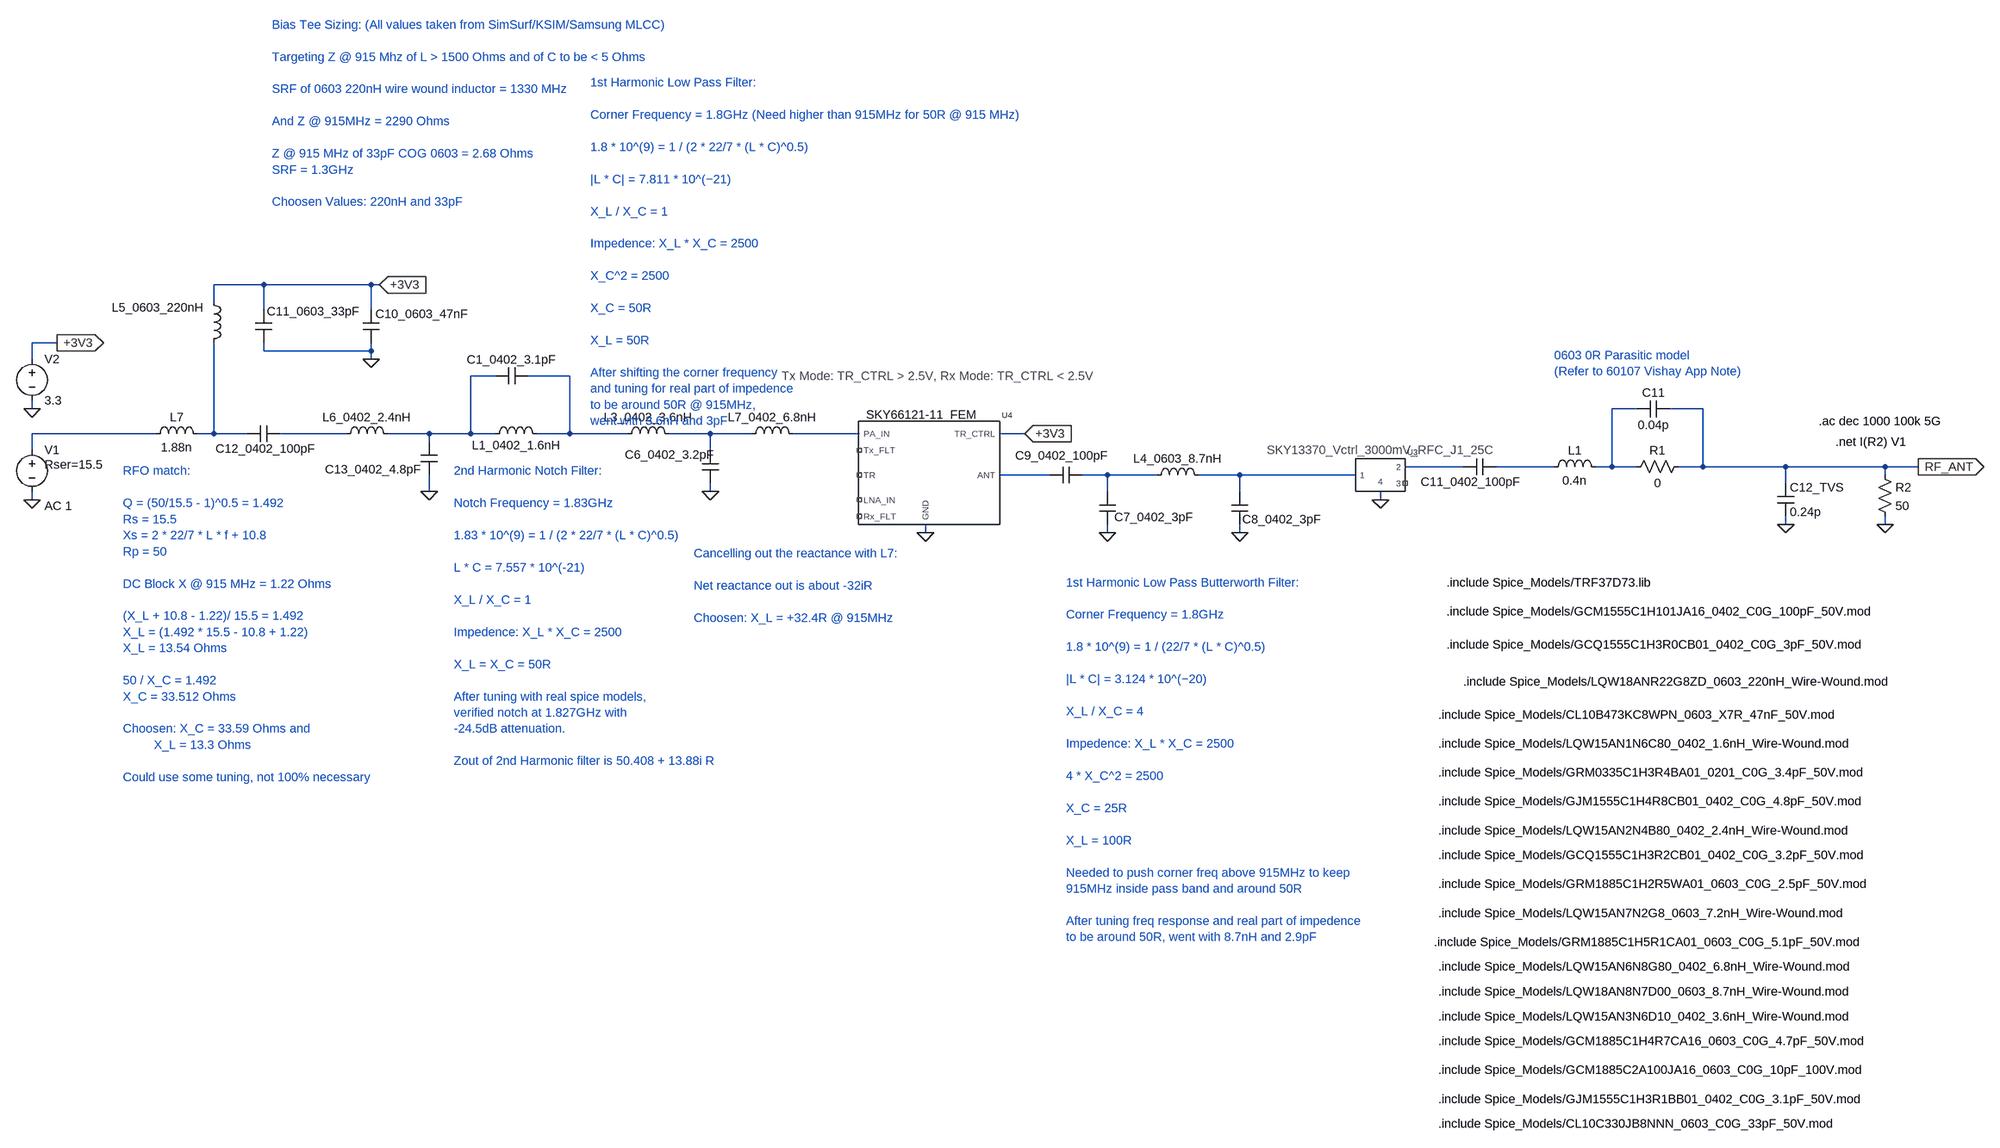
[diagram p0: schematic RF_Front_End_Real.asc]
RF_Front_End_Real.asc, the LTspice schematic file:
Version 4.1
SHEET 1 4856 1496
WIRE -1264 -240 -1360 -240
WIRE -1056 -240 -1264 -240
WIRE -1040 -240 -1056 -240
WIRE -1360 -208 -1360 -240
WIRE -1264 -192 -1264 -240
WIRE -1056 -192 -1056 -240
WIRE -1664 -128 -1712 -128
WIRE -1264 -112 -1264 -128
WIRE -1056 -112 -1056 -128
WIRE -1056 -112 -1264 -112
WIRE -1712 -96 -1712 -128
WIRE -1056 -96 -1056 -112
WIRE -816 -64 -864 -64
WIRE -672 -64 -752 -64
WIRE -1712 0 -1712 -16
WIRE 1392 0 1344 0
WIRE 1520 0 1456 0
WIRE -1472 48 -1712 48
WIRE -1360 48 -1360 -128
WIRE -1360 48 -1392 48
WIRE -1296 48 -1360 48
WIRE -1104 48 -1232 48
WIRE -944 48 -1024 48
WIRE -864 48 -864 -64
WIRE -864 48 -944 48
WIRE -816 48 -864 48
WIRE -672 48 -672 -64
WIRE -672 48 -736 48
WIRE -560 48 -672 48
WIRE -400 48 -480 48
WIRE -320 48 -400 48
WIRE -112 48 -240 48
WIRE 208 48 160 48
WIRE -944 64 -944 48
WIRE -1712 80 -1712 48
WIRE -400 80 -400 48
WIRE 1056 112 944 112
WIRE 1232 112 1120 112
WIRE 1344 112 1344 0
WIRE 1344 112 1312 112
WIRE 1392 112 1344 112
WIRE 1520 112 1520 0
WIRE 1520 112 1472 112
WIRE 1680 112 1520 112
WIRE 1872 112 1680 112
WIRE 1936 112 1872 112
WIRE 256 128 160 128
WIRE 368 128 320 128
WIRE 464 128 368 128
WIRE 624 128 544 128
WIRE 848 128 624 128
WIRE 1872 128 1872 112
WIRE 1680 144 1680 112
WIRE -944 160 -944 128
WIRE -400 160 -400 144
WIRE 368 160 368 128
WIRE 624 160 624 128
WIRE -1712 176 -1712 160
WIRE 896 176 896 160
WIRE 1680 224 1680 208
WIRE 1872 224 1872 208
WIRE 16 240 16 224
WIRE 368 240 368 224
WIRE 624 240 624 224
FLAG -400 160 0
FLAG 368 240 0
FLAG 624 240 0
FLAG 1936 112 RF_ANT
IOPIN 1936 112 Out
FLAG -1712 176 0
FLAG 1872 224 0
FLAG -1056 -96 0
FLAG -944 160 0
FLAG -1712 0 0
FLAG -1664 -128 +3V3
IOPIN -1664 -128 Out
FLAG -1040 -240 +3V3
IOPIN -1040 -240 In
FLAG 1680 224 0
FLAG 896 176 0
FLAG 208 48 +3V3
IOPIN 208 48 In
FLAG 16 240 0
SYMBOL ind -832 64 R270
WINDOW 0 -22 57 VTop 2
WINDOW 3 5 56 Invisible 2
SYMATTR InstName L1_0402_1.6nH
SYMATTR Value LQW15AN2N4B80
SYMATTR Prefix X
SYMBOL cap -752 -80 R90
WINDOW 0 0 32 VBottom 2
WINDOW 3 32 32 Invisible 2
SYMATTR InstName C1_0402_3.1pF
SYMATTR Value GJM1555C1H3R1BB01_DC0V_25degC
SYMATTR Prefix X
SYMBOL ind -576 64 R270
WINDOW 0 32 56 VTop 2
WINDOW 3 5 56 Invisible 2
SYMATTR InstName L3_0402_3.6nH
SYMATTR Value LQW15AN3N6D10
SYMATTR Prefix X
SYMBOL cap -416 80 R0
WINDOW 0 -149 9 Left 2
WINDOW 3 -149 37 Invisible 2
SYMATTR InstName C6_0402_3.2pF
SYMATTR Value GCQ1555C1H3R2CB01_DC0V_25degC
SYMATTR Prefix X
SYMBOL ind 448 144 R270
WINDOW 0 32 56 VTop 2
WINDOW 3 5 56 Invisible 2
SYMATTR InstName L4_0603_8.7nH
SYMATTR Value LQW18AN8N7D00
SYMATTR Prefix X
SYMBOL voltage -1712 64 R0
WINDOW 123 24 124 Left 2
WINDOW 39 24 44 Left 2
SYMATTR Value2 AC 1
SYMATTR SpiceLine Rser=15.5
SYMATTR InstName V1
SYMATTR Value ""
SYMBOL cap 352 160 R0
WINDOW 0 29 50 Left 2
WINDOW 3 24 56 Invisible 2
SYMATTR InstName C7_0402_3pF
SYMATTR Value GCQ1555C1H3R0CB01_DC0V_25degC
SYMATTR Prefix X
SYMBOL res 1856 112 R0
SYMATTR InstName R2
SYMATTR Value 50
SYMBOL ind -1376 -224 R0
WINDOW 0 -182 28 Left 2
WINDOW 3 36 80 Invisible 2
SYMATTR InstName L5_0603_220nH
SYMATTR Value LQW18ANR22G8Z
SYMATTR Prefix X
SYMBOL cap -1072 -192 R0
WINDOW 3 24 56 Invisible 2
SYMATTR Value CL10B473KC8WPN_Precise_DC3.3V_25degC
SYMATTR InstName C10_0603_47nF
SYMATTR Prefix X
SYMBOL cap -1248 -128 R180
WINDOW 0 -171 61 Left 2
WINDOW 3 24 8 Invisible 2
SYMATTR InstName C11_0603_33pF
SYMATTR Value CL10C330JB8NNN_Precise_DC0V_25degC
SYMATTR Prefix X
SYMBOL cap -1232 32 R90
WINDOW 0 61 28 VBottom 2
WINDOW 3 32 32 Invisible 2
SYMATTR InstName C12_0402_100pF
SYMATTR Value GCM1555C1H101JA16_DC0V_25degC
SYMATTR Prefix X
SYMBOL cap -960 64 R0
WINDOW 0 -185 53 Left 2
WINDOW 3 24 56 Invisible 2
SYMATTR InstName C13_0402_4.8pF
SYMATTR Value GJM1555C1H4R8CB01_DC0V_25degC
SYMATTR Prefix X
SYMBOL ind -1120 64 R270
WINDOW 0 32 56 VTop 2
WINDOW 3 5 56 Invisible 2
SYMATTR InstName L6_0402_2.4nH
SYMATTR Value LQW15AN2N4B80
SYMATTR Prefix X
SYMBOL ind -1488 64 R270
WINDOW 0 32 56 VTop 2
WINDOW 3 5 56 VBottom 2
SYMATTR InstName L7
SYMATTR Value 1.88n
SYMATTR SpiceLine Rser=1m
SYMBOL voltage -1712 -112 R0
WINDOW 123 0 0 Left 0
WINDOW 39 0 0 Left 0
SYMATTR InstName V2
SYMATTR Value 3.3
SYMBOL cap 608 160 R0
WINDOW 0 21 54 Left 2
WINDOW 3 24 56 Invisible 2
SYMATTR InstName C8_0402_3pF
SYMATTR Value GCQ1555C1H3R0CB01_DC0V_25degC
SYMATTR Prefix X
SYMBOL cap 1664 144 R0
SYMATTR InstName C12_TVS
SYMATTR Value 0.24p
SYMBOL SKY13370_Vctrl_3000mV_RFC_J1_25C 896 128 R0
SYMATTR InstName U3
SYMBOL cap 1392 16 R270
WINDOW 0 32 32 VTop 2
WINDOW 3 0 32 VBottom 2
SYMATTR InstName C11
SYMATTR Value 0.04p
SYMBOL ind 1216 128 R270
WINDOW 0 32 56 VTop 2
WINDOW 3 5 56 VBottom 2
SYMATTR InstName L1
SYMATTR Value 0.4n
SYMATTR SpiceLine Rser=0
SYMBOL res 1488 96 R90
WINDOW 0 0 56 VBottom 2
WINDOW 3 32 56 VTop 2
SYMATTR InstName R1
SYMATTR Value 0
SYMBOL cap 320 112 R90
WINDOW 0 -6 40 VBottom 2
WINDOW 3 32 32 Invisible 2
SYMATTR InstName C9_0402_100pF
SYMATTR Value GCM1555C1H101JA16_DC0V_25degC
SYMATTR Prefix X
SYMBOL cap 1120 96 R90
WINDOW 0 61 49 VBottom 2
WINDOW 3 32 32 Invisible 2
SYMATTR InstName C11_0402_100pF
SYMATTR Value GCM1555C1H101JA16_DC0V_25degC
SYMATTR Prefix X
SYMBOL Spice_Models\\SKY66121-11_FEM 16 96 R0
SYMATTR InstName U4
SYMBOL ind -336 64 R270
WINDOW 0 32 56 VTop 2
WINDOW 3 5 56 Invisible 2
SYMATTR InstName L7_0402_6.8nH
SYMATTR Value LQW15AN6N8G80
SYMATTR Prefix X
TEXT 1744 24 Left 2 !.ac dec 1000 100k 5G
TEXT 1776 64 Left 2 !.net I(R2) V1
TEXT 1024 456 Left 2 !.include Spice_Models/GCQ1555C1H3R0CB01_0402_C0G_3pF_50V.mod
TEXT 1056 528 Left 2 !.include Spice_Models/LQW18ANR22G8ZD_0603_220nH_Wire-Wound.mod
TEXT 1008 592 Left 2 !.include Spice_Models/CL10B473KC8WPN_0603_X7R_47nF_50V.mod
TEXT 1024 392 Left 2 !.include Spice_Models/GCM1555C1H101JA16_0402_C0G_100pF_50V.mod
TEXT 1008 648 Left 2 !.include Spice_Models/LQW15AN1N6C80_0402_1.6nH_Wire-Wound.mod
TEXT 1008 704 Left 2 !.include Spice_Models/GRM0335C1H3R4BA01_0201_C0G_3.4pF_50V.mod
TEXT 1008 760 Left 2 !.include Spice_Models/GJM1555C1H4R8CB01_0402_C0G_4.8pF_50V.mod
TEXT 1008 816 Left 2 !.include Spice_Models/LQW15AN2N4B80_0402_2.4nH_Wire-Wound.mod
TEXT 1008 864 Left 2 !.include Spice_Models/GCQ1555C1H3R2CB01_0402_C0G_3.2pF_50V.mod
TEXT 1008 920 Left 2 !.include Spice_Models/GRM1885C1H2R5WA01_0603_C0G_2.5pF_50V.mod
TEXT 1008 976 Left 2 !.include Spice_Models/LQW15AN7N2G8_0603_7.2nH_Wire-Wound.mod
TEXT 1000 1032 Left 2 !.include Spice_Models/GRM1885C1H5R1CA01_0603_C0G_5.1pF_50V.mod
TEXT 1008 1080 Left 2 !.include Spice_Models/LQW15AN6N8G80_0402_6.8nH_Wire-Wound.mod
TEXT 1008 1128 Left 2 !.include Spice_Models/LQW18AN8N7D00_0603_8.7nH_Wire-Wound.mod
TEXT 1008 1176 Left 2 !.include Spice_Models/LQW15AN3N6D10_0402_3.6nH_Wire-Wound.mod
TEXT 1024 336 Left 2 !.include Spice_Models/TRF37D73.lib
TEXT -1536 120 Left 2 ;RFO match:\n \nQ = (50/15.5 - 1)^0.5 = 1.492\nRs = 15.5\nXs = 2 * 22/7 * L * f + 10.8\nRp = 50\n \nDC Block X @ 915 MHz = 1.22 Ohms\n \n(X_L + 10.8 - 1.22)/ 15.5 = 1.492\nX_L = (1.492 * 15.5 - 10.8 + 1.22)\nX_L = 13.54 Ohms\n \n50 / X_C = 1.492\nX_C = 33.512 Ohms\n \nChoosen: X_C = 33.59 Ohms and \n         X_L = 13.3 Ohms\n \nCould use some tuning, not 100% necessary
TEXT -1248 -744 Left 2 ;Bias Tee Sizing: (All values taken from SimSurf/KSIM/Samsung MLCC)\n \nTargeting Z @ 915 Mhz of L > 1500 Ohms and of C to be < 5 Ohms\n \nSRF of 0603 220nH wire wound inductor = 1330 MHz\n \nAnd Z @ 915MHz = 2290 Ohms\n \nZ @ 915 MHz of 33pF COG 0603 = 2.68 Ohms\nSRF = 1.3GHz\n \nChoosen Values: 220nH and 33pF
TEXT 1008 1224 Left 2 !.include Spice_Models/GCM1885C1H4R7CA16_0603_C0G_4.7pF_50V.mod
TEXT -896 120 Left 2 ;2nd Harmonic Notch Filter:\n \nNotch Frequency = 1.83GHz\n \n1.83 * 10^(9) = 1 / (2 * 22/7 * (L * C)^0.5)\n \nL * C = 7.557 * 10^(-21)\n \nX_L / X_C = 1\n \nImpedence: X_L * X_C = 2500\n \nX_L = X_C = 50R\n \nAfter tuning with real spice models, \nverified notch at 1.827GHz with \n-24.5dB attenuation.\n \nZout of 2nd Harmonic filter is 50.408 + 13.88i R
TEXT 1008 1280 Left 2 !.include Spice_Models/GCM1885C2A100JA16_0603_C0G_10pF_100V.mod
TEXT -432 280 Left 2 ;Cancelling out the reactance with L7:\n \nNet reactance out is about -32iR\n \nChoosen: X_L = +32.4R @ 915MHz
TEXT 288 336 Left 2 ;1st Harmonic Low Pass Butterworth Filter:\n \nCorner Frequency = 1.8GHz\n \n1.8 * 10^(9) = 1 / (22/7 * (L * C)^0.5)\n \n|L * C| = 3.124 * 10^(−20)\n \nX_L / X_C = 4\n \nImpedence: X_L * X_C = 2500\n \n4 * X_C^2 = 2500\n \nX_C = 25R\n \nX_L = 100R\n \nNeeded to push corner freq above 915MHz to keep \n915MHz inside pass band and around 50R\n \nAfter tuning freq response and real part of impedence\nto be around 50R, went with 8.7nH and 2.9pF
TEXT 1008 1336 Left 2 !.include Spice_Models/GJM1555C1H3R1BB01_0402_C0G_3.1pF_50V.mod
TEXT 1232 -104 Left 2 ;0603 0R Parasitic model\n(Refer to 60107 Vishay App Note)
TEXT -632 -632 Left 2 ;1st Harmonic Low Pass Filter:\n \nCorner Frequency = 1.8GHz (Need higher than 915MHz for 50R @ 915 MHz)\n \n1.8 * 10^(9) = 1 / (2 * 22/7 * (L * C)^0.5)\n \n|L * C| = 7.811 * 10^(−21)\n \nX_L / X_C = 1\n \nImpedence: X_L * X_C = 2500\n \nX_C^2 = 2500\n \nX_C = 50R\n \nX_L = 50R\n \nAfter shifting the corner frequency \nand tuning for real part of impedence \nto be around 50R @ 915MHz, \nwent with 3.6nH and 3pF
TEXT 1008 1384 Left 2 !.include Spice_Models/CL10C330JB8NNN_0603_C0G_33pF_50V.mod

The netlist it stands for:
* RF_Front_End_Real.asc
X§L1_0402_1.6nH N001 N002 LQW15AN2N4B80  ; pins A B
X§C1_0402_3.1pF N002 N001 GJM1555C1H3R1BB01_DC0V_25degC  ; pins A B
X§L3_0402_3.6nH N002 N007 LQW15AN3N6D10  ; pins A B
X§C6_0402_3.2pF N007 0 GCQ1555C1H3R2CB01_DC0V_25degC  ; pins A B
X§L4_0603_8.7nH N012 N013 LQW18AN8N7D00  ; pins A B
V1 N004 0 AC 1 Rser=15.5
X§C7_0402_3pF N012 0 GCQ1555C1H3R0CB01_DC0V_25degC  ; pins A B
R2 RF_ANT 0 50
X§L5_0603_220nH +3V3 N005 LQW18ANR22G8Z  ; pins A B
X§C10_0603_47nF +3V3 0 CL10B473KC8WPN_Precise_DC3.3V_25degC  ; pins A B
X§C11_0603_33pF 0 +3V3 CL10C330JB8NNN_Precise_DC0V_25degC  ; pins A B
X§C12_0402_100pF N006 N005 GCM1555C1H101JA16_DC0V_25degC  ; pins A B
X§C13_0402_4.8pF N001 0 GJM1555C1H4R8CB01_DC0V_25degC  ; pins A B
X§L6_0402_2.4nH N006 N001 LQW15AN2N4B80  ; pins A B
L7 N004 N005 1.88n Rser=1m
V2 +3V3 0 3.3
X§C8_0402_3pF N013 0 GCQ1555C1H3R0CB01_DC0V_25degC  ; pins A B
C12_TVS RF_ANT 0 0.24p
X§U3 N013 N009 NC_01 0 SKY13370_Vctrl_3000mV_RFC_J1_25C  ; pins 1 2 3 4
C11 N003 RF_ANT 0.04p
L1 N010 N003 0.4n Rser=0
R1 RF_ANT N003 0
X§C9_0402_100pF N012 N011 GCM1555C1H101JA16_DC0V_25degC  ; pins A B
X§C11_0402_100pF N010 N009 GCM1555C1H101JA16_DC0V_25degC  ; pins A B
X§U4 NC_02 N008 NC_03 NC_04 NC_05 N011 +3V3 0 SKY66121-11_FEM  ; pins TR PA_IN Tx_FLT LNA_IN Rx_FLT ANT TR_CTRL GND
X§L7_0402_6.8nH N007 N008 LQW15AN6N8G80  ; pins A B
.ac dec 1000 100k 5G
.net I(R2) V1
.include Spice_Models/GCQ1555C1H3R0CB01_0402_C0G_3pF_50V.mod
.include Spice_Models/LQW18ANR22G8ZD_0603_220nH_Wire-Wound.mod
.include Spice_Models/CL10B473KC8WPN_0603_X7R_47nF_50V.mod
.include Spice_Models/GCM1555C1H101JA16_0402_C0G_100pF_50V.mod
.include Spice_Models/LQW15AN1N6C80_0402_1.6nH_Wire-Wound.mod
.include Spice_Models/GRM0335C1H3R4BA01_0201_C0G_3.4pF_50V.mod
.include Spice_Models/GJM1555C1H4R8CB01_0402_C0G_4.8pF_50V.mod
.include Spice_Models/LQW15AN2N4B80_0402_2.4nH_Wire-Wound.mod
.include Spice_Models/GCQ1555C1H3R2CB01_0402_C0G_3.2pF_50V.mod
.include Spice_Models/GRM1885C1H2R5WA01_0603_C0G_2.5pF_50V.mod
.include Spice_Models/LQW15AN7N2G8_0603_7.2nH_Wire-Wound.mod
.include Spice_Models/GRM1885C1H5R1CA01_0603_C0G_5.1pF_50V.mod
.include Spice_Models/LQW15AN6N8G80_0402_6.8nH_Wire-Wound.mod
.include Spice_Models/LQW18AN8N7D00_0603_8.7nH_Wire-Wound.mod
.include Spice_Models/LQW15AN3N6D10_0402_3.6nH_Wire-Wound.mod
.include Spice_Models/TRF37D73.lib
* RFO match:
* Q = (50/15.5 - 1)^0.5 = 1.492
* Rs = 15.5
* Xs = 2 * 22/7 * L * f + 10.8
* Rp = 50
* DC Block X @ 915 MHz = 1.22 Ohms
* (X_L + 10.8 - 1.22)/ 15.5 = 1.492
* X_L = (1.492 * 15.5 - 10.8 + 1.22)
* X_L = 13.54 Ohms
* 50 / X_C = 1.492
* X_C = 33.512 Ohms
* Choosen: X_C = 33.59 Ohms and
*          X_L = 13.3 Ohms
* Could use some tuning, not 100% necessary
* Bias Tee Sizing: (All values taken from SimSurf/KSIM/Samsung MLCC)
* Targeting Z @ 915 Mhz of L > 1500 Ohms and of C to be < 5 Ohms
* SRF of 0603 220nH wire wound inductor = 1330 MHz
* And Z @ 915MHz = 2290 Ohms
* Z @ 915 MHz of 33pF COG 0603 = 2.68 Ohms
* SRF = 1.3GHz
* Choosen Values: 220nH and 33pF
.include Spice_Models/GCM1885C1H4R7CA16_0603_C0G_4.7pF_50V.mod
* 2nd Harmonic Notch Filter:
* Notch Frequency = 1.83GHz
* 1.83 * 10^(9) = 1 / (2 * 22/7 * (L * C)^0.5)
* L * C = 7.557 * 10^(-21)
* X_L / X_C = 1
* Impedence: X_L * X_C = 2500
* X_L = X_C = 50R
* After tuning with real spice models,
* verified notch at 1.827GHz with
* -24.5dB attenuation.
* Zout of 2nd Harmonic filter is 50.408 + 13.88i R
.include Spice_Models/GCM1885C2A100JA16_0603_C0G_10pF_100V.mod
* Cancelling out the reactance with L7:
* Net reactance out is about -32iR
* Choosen: X_L = +32.4R @ 915MHz
* 1st Harmonic Low Pass Butterworth Filter:
* Corner Frequency = 1.8GHz
* 1.8 * 10^(9) = 1 / (22/7 * (L * C)^0.5)
* |L * C| = 3.124 * 10^(−20)
* X_L / X_C = 4
* Impedence: X_L * X_C = 2500
* 4 * X_C^2 = 2500
* X_C = 25R
* X_L = 100R
* Needed to push corner freq above 915MHz to keep
* 915MHz inside pass band and around 50R
* After tuning freq response and real part of impedence
* to be around 50R, went with 8.7nH and 2.9pF
.include Spice_Models/GJM1555C1H3R1BB01_0402_C0G_3.1pF_50V.mod
* 0603 0R Parasitic model
* (Refer to 60107 Vishay App Note)
* 1st Harmonic Low Pass Filter:
* Corner Frequency = 1.8GHz (Need higher than 915MHz for 50R @ 915 MHz)
* 1.8 * 10^(9) = 1 / (2 * 22/7 * (L * C)^0.5)
* |L * C| = 7.811 * 10^(−21)
* X_L / X_C = 1
* Impedence: X_L * X_C = 2500
* X_C^2 = 2500
* X_C = 50R
* X_L = 50R
* After shifting the corner frequency
* and tuning for real part of impedence
* to be around 50R @ 915MHz,
* went with 3.6nH and 3pF
.include Spice_Models/CL10C330JB8NNN_0603_C0G_33pF_50V.mod
.lib SKY13370_Vctrl_3000mV_RFC_J1_25C.inc
.lib SKY66122-11.lib
.backanno
.end